# Altium project Phone_Charger.PrjPcb (part 2 of 3)

## Sheet Battery_Management_Section.SchDoc
size A4; DocumentNumber: 4; SheetNumber: 4
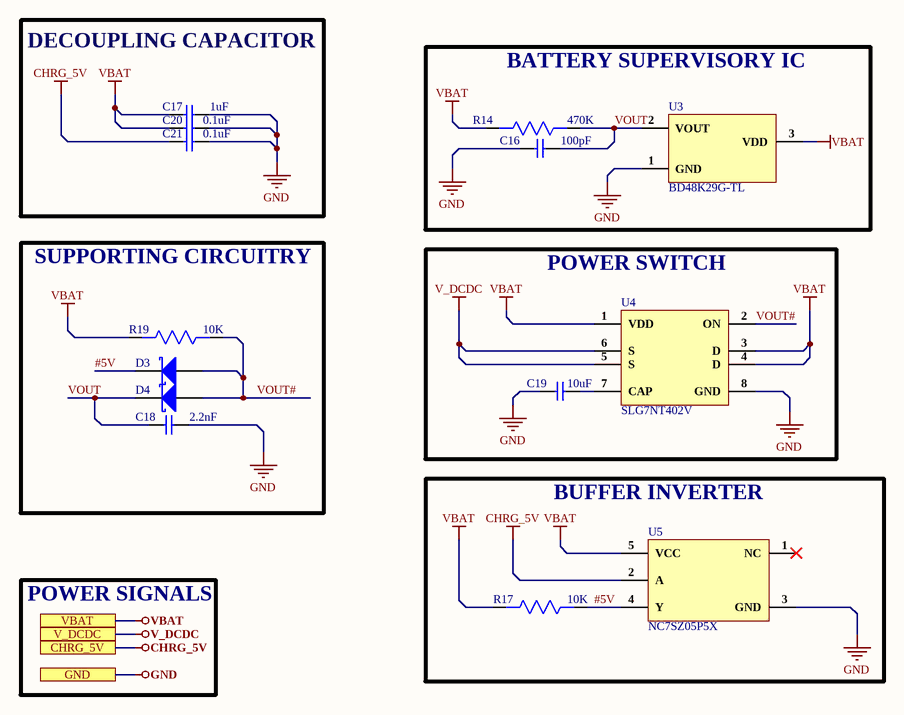
[diagram p3: Battery_Management_Section.SchDoc]

### Parts
C16  100pF  [Cap0603]
C17  1uF  [Cap0603]
C18  2.2nF  [Cap 0402]
C19  10uF  [Cap0603]
C20  0.1uF  [Cap0603]
C21  0.1uF  [Cap0603]
D3  SDM2U20SD3-7  [SDM2U20SD3-7]  (value not drawn)
D4  SDM2U20SD3-7  [SDM2U20SD3-7]  (value not drawn)
R14  470K  [Res0603]
R17  10K  [Res0603]
R19  10K  [Res0603]
U3  BD48K29G-TL  [3-SSOP]
U4  SLG7NT402V  [SLG7NT402V]
U5  NC7SZ05P5X  [NC7SZ05P5X]

### Blocks framed on the sheet
DECOUPLING CAPACITOR: C17 C20 C21
BATTERY SUPERVISORY IC: C16 R14 U3
SUPPORTING CIRCUITRY: C18 D3 D4 R19
POWER SWITCH: C19 U4
BUFFER INVERTER: R17 U5

### Ports
CHRG_5V, GND, V_DCDC, VBAT

### Nets
CHRG_5V: C21.1 U5.2(A) ; port CHRG_5V
GND: C16.2 C17.1 C18.2 C19.1 C20.2 C21.2 U3.1(GND) U4.8(GND) U5.3(GND) ; port GND
V_DCDC: U4.5(S) U4.6(S) ; port V_DCDC
VBAT: C17.2 C20.1 R14.1 R17.2 R19.2 U3.3(VDD) U4.1(VDD) U4.3(D) U4.4(D) U5.5(VCC) ; port VBAT
#5V: D3.2(K) R17.1 U5.4(Y)
VOUT: C16.1 C18.1 D4.2(K) R14.2 U3.2(VOUT)
VOUT#: D3.1(A) D4.1(A) R19.1 U4.2(ON)
NetC19_2: C19.2 U4.7(CAP)

Not connected (* = marked no-connect by the designer): U5 1(NC)*

### Notes on the sheet
- POWER SIGNALS

### Library data of the parts
C16 = CC0603JRNPO8BN101: CAP CER 100PF 25V C0G/NPO 0603; Manufacturer: Yageo; Tolerance: 5%; Dielectric: C0G; ComponentLink1URL: http://www.yageo.com/documents/recent/UPY-GPHC_Y5V_6.3V-to-50V_8.pdf?src-supplier=Digi-Key; ComponentLink1Description: http://www.yageo.com/documents/recent/UPY-GPHC_Y5V_6.3V-to-50V_8.pdf?src-supplier=Digi-Key; ComponentLink2URL: http://www.yageo.com/documents/recent/UPY-GPHC_Y5V_6.3V-to-50V_5.pdf?src-supplier=Avnet+Europe; ComponentLink2Description: http://www.yageo.com/documents/recent/UPY-GPHC_Y5V_6.3V-to-50V_5.pdf?src-supplier=Avnet+Europe; ComponentLink3URL: https://www.verical.com/server-webapp/html/getDatasheet?partID=403611&src-supplier=Verical; ComponentLink3Description: https://www.verical.com/server-webapp/html/getDatasheet?partID=403611&src-supplier=Verical; ComponentLink4URL: http://www.mouser.com/ds/2/447/Yageo_UPY-GP_NP0_16V-to-50V_9-358835.pdf?src-supplier=Mouser; ComponentLink4Description: http://www.mouser.com/ds/2/447/Yageo_UPY-GP_NP0_16V-to-50V_9-358835.pdf?src-supplier=Mouser; ComponentLink5URL: http://www.farnell.com/datasheets/1132289.pdf?src-supplier=Element14; ComponentLink5Description: http://www.farnell.com/datasheets/1132289.pdf?src-supplier=Element14; Supplier 1: Digi-Key; Manufacturer Part Number: CC0603JRNPO8BN101; Stock 1: 19776; Pricing 1: 1=0.1, 10=0.058, 50=0.0318, 100=0.026, 500=0.0186, 1000=0.0146 (USD); Mount: Surface Mount; Case/Package: 0603; Min Operating Temperature: -55°C; Max Operating Temperature: 125°C; Capacitance: 100pF; Voltage Rating (DC): 25V; Packaging: Tape and Reel; Voltage Rating: 25V; Resistor Type: Ceramic; Series: CC; Construction: Flat; Length: 0.063inch; Width: 0.031inch; Height: 0.8mm; Thickness: 0.035inch; Depth: 0.8mm; Radiation Hardening: No; RoHS Compliant: Yes; ComponentLink6URL: http://www.yageo.com/documents/recent/UPY-GP_NP0_16V-to-50V_8.pdf?src-supplier=Avnet; ComponentLink6Description: http://www.yageo.com/documents/recent/UPY-GP_NP0_16V-to-50V_8.pdf?src-supplier=Avnet; ComponentLink7URL: http://www.yageo.com/documents/recent/UPY-GP_NP0_16V-to-50V_8.pdf?src-supplier=Avnet+Europe; ComponentLink7Description: http://www.yageo.com/documents/recent/UPY-GP_NP0_16V-to-50V_8.pdf?src-supplier=Avnet+Europe; Supplier Part Number 1: 311-3949-1-ND
C17 = CC0603ZRY5V8BB105: CAP CER 1UF 25V Y5V 0603; Manufacturer: Yageo; Tolerance: 80%; ComponentLink1URL: http://www.yageo.com/documents/recent/UPY-GPHC_Y5V_6.3V-to-50V_8.pdf?src-supplier=Digi-Key; ComponentLink1Description: http://www.yageo.com/documents/recent/UPY-GPHC_Y5V_6.3V-to-50V_8.pdf?src-supplier=Digi-Key; ComponentLink2URL: http://www.yageo.com/documents/recent/UPY-GPHC_Y5V_6.3V-to-50V_5.pdf?src-supplier=Avnet+Europe; ComponentLink2Description: http://www.yageo.com/documents/recent/UPY-GPHC_Y5V_6.3V-to-50V_5.pdf?src-supplier=Avnet+Europe; ComponentLink3URL: https://www.verical.com/server-webapp/html/getDatasheet?partID=403611&src-supplier=Verical; ComponentLink3Description: https://www.verical.com/server-webapp/html/getDatasheet?partID=403611&src-supplier=Verical; ComponentLink4URL: http://www.mouser.com/ds/2/447/Yageo_UPY-GP_NP0_16V-to-50V_9-358835.pdf?src-supplier=Mouser; ComponentLink4Description: http://www.mouser.com/ds/2/447/Yageo_UPY-GP_NP0_16V-to-50V_9-358835.pdf?src-supplier=Mouser; ComponentLink5URL: http://www.farnell.com/datasheets/1132289.pdf?src-supplier=Element14; ComponentLink5Description: http://www.farnell.com/datasheets/1132289.pdf?src-supplier=Element14; Supplier 1: Digi-Key; Manufacturer Part Number: CC0603ZRY5V8BB105; Stock 1: 82432; Pricing 1: 1=0.13, 10=0.096, 50=0.0544, 100=0.045, 500=0.0316, 1000=0.0261 (USD); Mount: Surface Mount; Case/Package: 0603; Case Code (Imperial): 0603; Case Code (Metric): 1608; Min Operating Temperature: -30°C; Max Operating Temperature: 85°C; Voltage Rating (DC): 25V; Packaging: Tape and Reel; Capacitance: 1uF; Voltage Rating: 25V; Dielectric: Y5V; Termination: SMD/SMT; Resistor Type: Ceramic; Series: CC; Length: 0.063inch; Width: 0.031inch; Height: 0.8mm; Thickness: 0.035inch; Lead Free: Lead Free; Halogen Free: Halogen Free; RoHS Compliant: Yes; Supplier Part Number 1: 311-1829-1-ND
C18 = C0402C222J3GEC7867: CAP CER 0402 2.2NF 25V C0G 5%; Manufacturer: KEMET; ComponentLink1URL: http://www.yageo.com/documents/recent/UPY-GPHC_Y5V_6.3V-to-50V_8.pdf?src-supplier=Digi-Key; ComponentLink1Description: http://www.yageo.com/documents/recent/UPY-GPHC_Y5V_6.3V-to-50V_8.pdf?src-supplier=Digi-Key; ComponentLink2URL: http://www.yageo.com/documents/recent/UPY-GPHC_Y5V_6.3V-to-50V_5.pdf?src-supplier=Avnet+Europe; ComponentLink2Description: http://www.yageo.com/documents/recent/UPY-GPHC_Y5V_6.3V-to-50V_5.pdf?src-supplier=Avnet+Europe; ComponentLink3URL: https://www.verical.com/server-webapp/html/getDatasheet?partID=403611&src-supplier=Verical; ComponentLink3Description: https://www.verical.com/server-webapp/html/getDatasheet?partID=403611&src-supplier=Verical; ComponentLink4URL: http://www.mouser.com/ds/2/447/Yageo_UPY-GP_NP0_16V-to-50V_9-358835.pdf?src-supplier=Mouser; ComponentLink4Description: http://www.mouser.com/ds/2/447/Yageo_UPY-GP_NP0_16V-to-50V_9-358835.pdf?src-supplier=Mouser; ComponentLink5URL: http://www.farnell.com/datasheets/1132289.pdf?src-supplier=Element14; ComponentLink5Description: http://www.farnell.com/datasheets/1132289.pdf?src-supplier=Element14; ComponentLink6URL: http://www.yageo.com/documents/recent/UPY-GP_NP0_16V-to-50V_8.pdf?src-supplier=Avnet; ComponentLink6Description: http://www.yageo.com/documents/recent/UPY-GP_NP0_16V-to-50V_8.pdf?src-supplier=Avnet; ComponentLink7URL: http://www.yageo.com/documents/recent/UPY-GP_NP0_16V-to-50V_8.pdf?src-supplier=Avnet+Europe; ComponentLink7Description: http://www.yageo.com/documents/recent/UPY-GP_NP0_16V-to-50V_8.pdf?src-supplier=Avnet+Europe; Supplier 1: Digi-Key; Manufacturer Part Number: C0402C222J3GEC7867; Stock 1: 5024; Pricing 1: 1=0.17, 10=0.123, 50=0.07, 100=0.058, 500=0.0407, 1000=0.0337, 2500=0.0314, 5000=0.0287 (USD); ComponentLink8URL: https://api.kemet.com/component-edge/download/datasheet/C0402C222J3GEC7867.pdf?src-supplier=Digi-Key; ComponentLink8Description: https://api.kemet.com/component-edge/download/datasheet/C0402C222J3GEC7867.pdf?src-supplier=Digi-Key; Supplier Part Number 1: 399-C0402C222J3GEC7867CT-ND
C19 = CC0603MRX5R8BB106: CAP CER 10UF 25V X5R 0603; Manufacturer: Yageo; Tolerance: 20%; ComponentLink1URL: http://www.yageo.com/documents/recent/UPY-GPHC_Y5V_6.3V-to-50V_8.pdf?src-supplier=Digi-Key; ComponentLink1Description: http://www.yageo.com/documents/recent/UPY-GPHC_Y5V_6.3V-to-50V_8.pdf?src-supplier=Digi-Key; ComponentLink2URL: http://www.yageo.com/documents/recent/UPY-GPHC_Y5V_6.3V-to-50V_5.pdf?src-supplier=Avnet+Europe; ComponentLink2Description: http://www.yageo.com/documents/recent/UPY-GPHC_Y5V_6.3V-to-50V_5.pdf?src-supplier=Avnet+Europe; ComponentLink3URL: https://www.verical.com/server-webapp/html/getDatasheet?partID=403611&src-supplier=Verical; ComponentLink3Description: https://www.verical.com/server-webapp/html/getDatasheet?partID=403611&src-supplier=Verical; ComponentLink4URL: http://www.mouser.com/ds/2/447/Yageo_UPY-GP_NP0_16V-to-50V_9-358835.pdf?src-supplier=Mouser; ComponentLink4Description: http://www.mouser.com/ds/2/447/Yageo_UPY-GP_NP0_16V-to-50V_9-358835.pdf?src-supplier=Mouser; ComponentLink5URL: http://www.farnell.com/datasheets/1132289.pdf?src-supplier=Element14; ComponentLink5Description: http://www.farnell.com/datasheets/1132289.pdf?src-supplier=Element14; Supplier 1: Digi-Key; Manufacturer Part Number: CC0603MRX5R8BB106; Stock 1: 0; Pricing 1: 1=0.77, 10=0.568, 50=0.4542, 100=0.3893, 500=0.3082, 1000=0.2595 (USD); Mount: Surface Mount; Case/Package: 0603; Case Code (Imperial): 0603; Case Code (Metric): 1608; Min Operating Temperature: -55°C; Max Operating Temperature: 85°C; Packaging: Cut Tape; Capacitance: 10uF; Voltage Rating: 25V; RoHS Compliant: Yes; ComponentLink6URL: https://www.yageo.com/upload/media/product/productsearch/datasheet/mlcc/UPY-GPHC_X5R_4V-to-50V_26.pdf?src-supplier=Digi-Key; ComponentLink6Description: https://www.yageo.com/upload/media/product/productsearch/datasheet/mlcc/UPY-GPHC_X5R_4V-to-50V_26.pdf?src-supplier=Digi-Key; Supplier Part Number 1: 311-3494-6-ND
C20 C21 = CC0603ZRY5V9BB104: CAP CER 0.1UF 50V Y5V 0603; Manufacturer: Yageo; Capacitance: 100nF; Tolerance: 80%; Supplier 1: Digi-Key; Manufacturer Part Number: CC0603ZRY5V9BB104; Stock 1: 15000880; Pricing 1: 1=0.1, 10=0.075, 100=0.0334, 500=0.02386, 1000=0.01874 (USD); Mount: Surface Mount; Case/Package: 0603; Number of Pins: 2; Case Code (Metric): 1608; Case Code (Imperial): 0603; Min Operating Temperature: -30°C; Max Operating Temperature: 85°C; Dielectric: Y5V; Voltage Rating: 50V; Package Quantity: 1; Packaging: Tape and Reel; Voltage Rating (DC): 50V; Termination: SMD/SMT; Composition: Ceramic; Voltage: 50V; Length: 1.6mm; Height: 0.8mm; Width: 0.031inch; Thickness: 0.035inch; Depth: 0.8mm; Radiation Hardening: No; REACH SVHC: No SVHC; Lead Free: Lead Free; Halogen Free: Halogen Free; ComponentLink1URL: http://www.yageo.com/documents/recent/UPY-GPHC_Y5V_6.3V-to-50V_8.pdf?src-supplier=Digi-Key; ComponentLink1Description: http://www.yageo.com/documents/recent/UPY-GPHC_Y5V_6.3V-to-50V_8.pdf?src-supplier=Digi-Key; ComponentLink2URL: http://www.yageo.com/documents/recent/UPY-GPHC_Y5V_6.3V-to-50V_5.pdf?src-supplier=Avnet+Europe; ComponentLink2Description: http://www.yageo.com/documents/recent/UPY-GPHC_Y5V_6.3V-to-50V_5.pdf?src-supplier=Avnet+Europe; ComponentLink3URL: https://www.verical.com/server-webapp/html/getDatasheet?partID=403611&src-supplier=Verical; ComponentLink3Description: https://www.verical.com/server-webapp/html/getDatasheet?partID=403611&src-supplier=Verical; ComponentLink4URL: http://www.mouser.com/ds/2/447/Yageo_UPY-GP_NP0_16V-to-50V_9-358835.pdf?src-supplier=Mouser; ComponentLink4Description: http://www.mouser.com/ds/2/447/Yageo_UPY-GP_NP0_16V-to-50V_9-358835.pdf?src-supplier=Mouser; ComponentLink5URL: http://www.farnell.com/datasheets/1132289.pdf?src-supplier=Element14; ComponentLink5Description: http://www.farnell.com/datasheets/1132289.pdf?src-supplier=Element14; Supplier Part Number 1: 311-1343-1-ND
D3 D4 = SDM2U20SD3-7: DIODE SCHOTTKY 20V 2A SOD323; Manufacturer: Diodes; Supplier 1: Digi-Key; Manufacturer Part Number: SDM2U20SD3-7; RoHS: Yes; Category: Rectifier Diodes; Stock 1: 6; Pricing 1: 1=0.47000, 10=0.35200, 100=0.19930, 500=0.13200, 1000=0.10120 (USD); Mount: Surface Mount; Packaging: Cut Tape; Average Rectified Current: 2A; Max Reverse Voltage (DC): 20V; RoHS Compliant: Yes; ComponentLink1URL: http://www.mouser.com/ds/2/115/SDM2U20SD3-537776.pdf?src-supplier=Mouser; ComponentLink1Description: http://www.mouser.com/ds/2/115/SDM2U20SD3-537776.pdf?src-supplier=Mouser; ComponentLink2URL: https://www.diodes.com/assets/Datasheets/SDM2U20SD3.pdf?src-supplier=Digi-Key; ComponentLink2Description: https://www.diodes.com/assets/Datasheets/SDM2U20SD3.pdf?src-supplier=Digi-Key; ComponentLink3URL: http://diodes.com/datasheets/SDM2U20SD3.pdf?src-supplier=Avnet; ComponentLink3Description: http://diodes.com/datasheets/SDM2U20SD3.pdf?src-supplier=Avnet; Supplier Part Number 1: SDM2U20SD3-7DICT-ND
R14 = RC0603JR-07470KL: RES 470K OHM 5% 1/10W 0603; Manufacturer: Yageo; Resistance: 470kR; Temperature Coefficient: 100ppm/°C; Voltage Rating (DC): 50V; Power Rating: 100mW; Voltage Rating: 75V; ComponentLink1URL: https://datasheet.ciiva.com/2452/pyu-r-int-thick-7-2452918.pdf?src-supplier=Digi-Key; ComponentLink1Description: https://datasheet.ciiva.com/2452/pyu-r-int-thick-7-2452918.pdf?src-supplier=Digi-Key; ComponentLink2URL: https://datasheet.ciiva.com/2452/pyu-r-int-thick-7-2452919.pdf?src-supplier=Digi-Key; ComponentLink2Description: https://datasheet.ciiva.com/2452/pyu-r-int-thick-7-2452919.pdf?src-supplier=Digi-Key; ComponentLink3URL: https://datasheet.ciiva.com/7746/443971-7746489.pdf?src-supplier=Element14; ComponentLink3Description: https://datasheet.ciiva.com/7746/443971-7746489.pdf?src-supplier=Element14; ComponentLink4URL: https://datasheet.ciiva.com/7746/443971-7746490.pdf?src-supplier=Element14; ComponentLink4Description: https://datasheet.ciiva.com/7746/443971-7746490.pdf?src-supplier=Element14; ComponentLink5URL: https://datasheet.ciiva.com/46395/443971-46395146.pdf?src-supplier=Element14; ComponentLink5Description: https://datasheet.ciiva.com/46395/443971-46395146.pdf?src-supplier=Element14; ComponentLink6URL: https://datasheet.ciiva.com/15189/getdatasheetpartid-343810-15189869.pdf?src-supplier=Verical; ComponentLink6Description: https://datasheet.ciiva.com/15189/getdatasheetpartid-343810-15189869.pdf?src-supplier=Verical; Supplier 1: Digi-Key; Manufacturer Part Number: RC0603JR-07470KL; Stock 1: 1213798; Pricing 1: 1=0.1, 10=0.02, 100=0.008, 1000=0.0036, 2500=0.0031 (USD); Case/Package: 0603; Number of Pins: 2; Case Code (Metric): 1608; Case Code (Imperial): 0603; Weight: 7.1E-05oz; Size Code: 0603; Min Operating Temperature: -55°C; Max Operating Temperature: 155°C; Tolerance: 5%; Resistor Type: Thick Film; Packaging: Tape and Reel; Package Quantity: 1; Number of Terminations: 2; Termination: SMD/SMT; Max Power Dissipation: 100mW; Features: Moisture Resistant; Series: RC; Resistance Tolerance: 5%; Construction: Rectangular; Length: 1.6mm; Width: 0.8mm; Height: 0.022inch; Depth: 0.8mm; REACH SVHC: No SVHC; Lead Free: Lead Free; Military Standard: Not; RoHS Compliant: Yes; ComponentLink7URL: http://www.yageo.com/documents/recent/PYu-RC_Group_51_RoHS_L_10.pdf?src-supplier=Digi-Key; ComponentLink7Description: http://www.yageo.com/documents/recent/PYu-RC_Group_51_RoHS_L_10.pdf?src-supplier=Digi-Key; ComponentLink8URL: http://www.yageo.com/documents/recent/PYu-RC_Group_51_RoHS_L_9.pdf?src-supplier=Digi-Key; ComponentLink8Description: http://www.yageo.com/documents/recent/PYu-RC_Group_51_RoHS_L_9.pdf?src-supplier=Digi-Key; ComponentLink9URL: http://www.farnell.com/datasheets/1868787.pdf?src-supplier=Element14; ComponentLink9Description: http://www.farnell.com/datasheets/1868787.pdf?src-supplier=Element14; Supplier Part Number 1: 311-470KGRCT-ND
R17 R19 = AC0603JR-0710KL: RES SMD 10K OHM 5% 1/10W 0603; Manufacturer: Yageo; Voltage Rating: 50V; Resistance: 10kR; Power Rating: 100mW; Temperature Coefficient: 100ppm/°C; Supplier 1: Future Electronics; Manufacturer Part Number: AC0603JR-0710KL; RoHS: Yes; Category: Chip SMD Resistors; Stock 1: 1533000; Pricing 1: 5000=0.00540 (USD); Case/Package: 0603; Case Code (Imperial): 0603; Case Code (Metric): 1608; Size Code: 0603; Min Operating Temperature: -55°C; Max Operating Temperature: 155°C; Packaging: Tape and Reel; Tolerance: 5%; Package Quantity: 1; Resistor Type: Thick Film; Termination: SMD/SMT; Number of Terminations: 2; Max Power Dissipation: 100mW; Features: Moisture Resistant,Automotive AEC-Q200,Anti-Sulfur; Series: AC; Construction: Rectangular; Length: 0.063inch; Width: 0.031inch; Height: 0.022inch; Depth: 0.8mm; Military Standard: Not; Lead Free: Lead Free; RoHS Compliant: Yes; ComponentLink1URL: https://datasheet.ciiva.com/5562/pyu-ac-51-rohs-l-2-5562553.pdf?src-supplier=Mouser; ComponentLink1Description: https://datasheet.ciiva.com/5562/pyu-ac-51-rohs-l-2-5562553.pdf?src-supplier=Mouser; Supplier Part Number 1: 1029044
U3 = BD48K29G-TL: IC DETECTOR VOLT 2.9V OD SSOP3; Manufacturer: Rohm; Max Supply Voltage: 6V; Min Supply Voltage: 2.3V; Number of Voltages Monitored: 1; Reset: Active Low; Accuracy: 1%; Operating Supply Current: 900nA; Max Reset Threshold Voltage: 2.929V; Min Reset Threshold Voltage: 2.871V; Supplier 1: Mouser; Manufacturer Part Number: BD48K29G-TL; RoHS: Yes; Category: Voltage Supervisors; Stock 1: 2854; Pricing 1: 1=0.48000, 10=0.39100, 50=0.39100, 100=0.24100, 500=0.20000, 1000=0.15000, 3000=0.13600, 10000=0.13600 (USD); Mount: Surface Mount; Case/Package: SSOP; Number of Pins: 3; Min Operating Temperature: -40°C; Max Operating Temperature: 105°C; Packaging: Tape and Reel; Package Quantity: 1; Threshold Voltage: 2.9V; Number of Monitored Inputs: 1; Type: Simple Reset/Power-On Reset,Voltage Detector; Series: BD48xxx; Radiation Hardening: No; Lead Free: Lead Free; RoHS Compliant: Yes; ComponentLink1URL: https://datasheet.ciiva.com/15105/getdatasheetpartid-705726-15105774.pdf?src-supplier=Verical; ComponentLink1Description: https://datasheet.ciiva.com/15105/getdatasheetpartid-705726-15105774.pdf?src-supplier=Verical; ComponentLink2URL: https://datasheet.ciiva.com/6598/bd48xxg-e-6598662.pdf?src-supplier=Digi-Key; ComponentLink2Description: https://datasheet.ciiva.com/6598/bd48xxg-e-6598662.pdf?src-supplier=Digi-Key; Supplier Part Number 1: 755-BD48K29G-TL
U4 = SLG7NT402V: IC PWR SWITCH N-CHAN 1:1 8TDFN; Manufacturer: Dialog Semiconductor; Number of Outputs: 1; Output Configuration: High Side; Max Output Current: 4A; ComponentLink1URL: https://datasheet.ciiva.com/3231/lmr62014-3231410.pdf?src-supplier=Avnet; ComponentLink1Description: https://datasheet.ciiva.com/3231/lmr62014-3231410.pdf?src-supplier=Avnet; ComponentLink2URL: https://datasheet.ciiva.com/23854/1777788-23854326.pdf?src-supplier=Newark; ComponentLink2Description: https://datasheet.ciiva.com/23854/1777788-23854326.pdf?src-supplier=Newark; ComponentLink3URL: https://datasheet.ciiva.com/4879/snvs735a-74121-4879731.pdf?src-supplier=Mouser; ComponentLink3Description: https://datasheet.ciiva.com/4879/snvs735a-74121-4879731.pdf?src-supplier=Mouser; ComponentLink4URL: https://datasheet.ciiva.com/22669/1716576-22669414.pdf?src-supplier=Element14; ComponentLink4Description: https://datasheet.ciiva.com/22669/1716576-22669414.pdf?src-supplier=Element14; ComponentLink5URL: https://datasheet.ciiva.com/6603/lmr62014-6603804.pdf?src-supplier=Digi-Key; ComponentLink5Description: https://datasheet.ciiva.com/6603/lmr62014-6603804.pdf?src-supplier=Digi-Key; ComponentLink6URL: https://datasheet.ciiva.com/6603/lmr62014-6603807.pdf?src-supplier=Digi-Key; ComponentLink6Description: https://datasheet.ciiva.com/6603/lmr62014-6603807.pdf?src-supplier=Digi-Key; ComponentLink7URL: https://www.verical.com/server-webapp/html/getDatasheet?partID=705722&src-supplier=Verical; ComponentLink7Description: https://www.verical.com/server-webapp/html/getDatasheet?partID=705722&src-supplier=Verical; ComponentLink8URL: http://rohmfs.rohm.com/en/techdata_basic/ic/package/ssop3_1-e.pdf?src-supplier=Digi-Key; ComponentLink8Description: http://rohmfs.rohm.com/en/techdata_basic/ic/package/ssop3_1-e.pdf?src-supplier=Digi-Key; ComponentLink9URL: http://rohmfs.rohm.com/en/products/databook/datasheet/ic/power/voltage_detector/bd48xxg-e.pdf?src-supplier=Digi-Key; ComponentLink9Description: http://rohmfs.rohm.com/en/products/databook/datasheet/ic/power/voltage_detector/bd48xxg-e.pdf?src-supplier=Digi-Key; Supplier 1: Digi-Key; Manufacturer Part Number: SLG7NT402V; Stock 1: 74575; Pricing 1: 1=0.67, 10=0.591, 25=0.5548, 100=0.4529, 250=0.4206, 500=0.358, 1000=0.2864 (USD); Number of Pins: 8; Min Operating Temperature: -20°C; Max Operating Temperature: 70°C; Packaging: Cut Tape; Supplier Part Number 1: 1827-1124-1-ND
U5 = NC7SZ05P5X: IC INVERTER OD 1CH 1-INP SC70-5; Manufacturer: ON Semiconductor / Fairchild; Number of Terminals/Pins: 5; Number of Circuits: 1; Max Supply Voltage: 5.5V; Min Supply Voltage: 1.65V; Propagation Delay: 13.4ns; Logic Function: Buffer,Inverter; Output Current: 32mA; Quiescent Current: 2uA; Turn-On Delay Time: 4.3ns; Polarity: Inverting; Schmitt Trigger Input: No; Input Type: SINGLE-ENDED; ComponentLink1URL: https://datasheet.ciiva.com/3231/lmr62014-3231410.pdf?src-supplier=Avnet; ComponentLink1Description: https://datasheet.ciiva.com/3231/lmr62014-3231410.pdf?src-supplier=Avnet; ComponentLink2URL: https://datasheet.ciiva.com/23854/1777788-23854326.pdf?src-supplier=Newark; ComponentLink2Description: https://datasheet.ciiva.com/23854/1777788-23854326.pdf?src-supplier=Newark; ComponentLink3URL: https://datasheet.ciiva.com/4879/snvs735a-74121-4879731.pdf?src-supplier=Mouser; ComponentLink3Description: https://datasheet.ciiva.com/4879/snvs735a-74121-4879731.pdf?src-supplier=Mouser; ComponentLink4URL: https://datasheet.ciiva.com/22669/1716576-22669414.pdf?src-supplier=Element14; ComponentLink4Description: https://datasheet.ciiva.com/22669/1716576-22669414.pdf?src-supplier=Element14; ComponentLink5URL: https://datasheet.ciiva.com/6603/lmr62014-6603804.pdf?src-supplier=Digi-Key; ComponentLink5Description: https://datasheet.ciiva.com/6603/lmr62014-6603804.pdf?src-supplier=Digi-Key; ComponentLink6URL: https://datasheet.ciiva.com/6603/lmr62014-6603807.pdf?src-supplier=Digi-Key; ComponentLink6Description: https://datasheet.ciiva.com/6603/lmr62014-6603807.pdf?src-supplier=Digi-Key; Supplier 1: Digi-Key; Manufacturer Part Number: NC7SZ05P5X; RoHS: Yes; Category: Amplifiers - Op Amps, Buffer, Instrumentation; Stock 1: 165573; Pricing 1: 1=0.41000, 10=0.30800, 25=0.26920, 100=0.17430, 250=0.14428, 500=0.11544, 1000=0.08850 (USD); Mount: Surface Mount; Case/Package: SC; Number of Pins: 5; Weight: 23g; Min Operating Temperature: -40°C; Max Operating Temperature: 85°C; Packaging: Tape and Reel; Package Quantity: 1; Low Level Output Current: 32mA; Number of Gates: 1; Number of Channels: 1; Number of Inputs: 1; Number of Outputs: 1; Max Output Current: 32mA; Number of Elements: 1; Termination: SMD/SMT; Series: 7SZ; Technology: CMOS; Number of Functions: 1; Supply Voltage-Nom: 5.5V; Length: 2mm; Width: 1.25mm; Height: 1mm; Radiation Hardening: No; REACH SVHC: No SVHC; Lead Free: Lead Free; RoHS Compliant: Yes; ComponentLink7URL: https://datasheet.ciiva.com/5701/678459-5701517.pdf?src-supplier=Farnell; ComponentLink7Description: https://datasheet.ciiva.com/5701/678459-5701517.pdf?src-supplier=Farnell; ComponentLink8URL: https://datasheet.ciiva.com/26097/nc7sz05-26097353.pdf?src-supplier=Avnet+Europe; ComponentLink8Description: https://datasheet.ciiva.com/26097/nc7sz05-26097353.pdf?src-supplier=Avnet+Europe; ComponentLink9URL: https://datasheet.ciiva.com/46415/678459-46415099.pdf?src-supplier=Element14; ComponentLink9Description: https://datasheet.ciiva.com/46415/678459-46415099.pdf?src-supplier=Element14; ComponentLink10URL: https://datasheet.ciiva.com/16783/nc7sz05-16783085.pdf?src-supplier=Future+Electronics; ComponentLink10Description: https://datasheet.ciiva.com/16783/nc7sz05-16783085.pdf?src-supplier=Future+Electronics; ComponentLink11URL: https://datasheet.ciiva.com/1861/nc7sz05-1861934.pdf?src-supplier=Digi-Key; ComponentLink11Description: https://datasheet.ciiva.com/1861/nc7sz05-1861934.pdf?src-supplier=Digi-Key; ComponentLink12URL: https://datasheet.ciiva.com/7970/678459-7970639.pdf?src-supplier=Element14; ComponentLink12Description: https://datasheet.ciiva.com/7970/678459-7970639.pdf?src-supplier=Element14; ComponentLink13URL: https://datasheet.ciiva.com/1861/nc7sz05-1861932.pdf?src-supplier=Digi-Key; ComponentLink13Description: https://datasheet.ciiva.com/1861/nc7sz05-1861932.pdf?src-supplier=Digi-Key; ComponentLink14URL: https://datasheet.ciiva.com/5701/nc7sz05-5701516.pdf?src-supplier=Farnell; ComponentLink14Description: https://datasheet.ciiva.com/5701/nc7sz05-5701516.pdf?src-supplier=Farnell; ComponentLink15URL: https://datasheet.ciiva.com/1861/nc7sz05-1861933.pdf?src-supplier=Digi-Key; ComponentLink15Description: https://datasheet.ciiva.com/1861/nc7sz05-1861933.pdf?src-supplier=Digi-Key; Supplier Part Number 1: NC7SZ05P5XCT-ND

## Sheet Connector_Section.SchDoc
size A4; DocumentNumber: 9; SheetNumber: 9; SheetTotal: 8
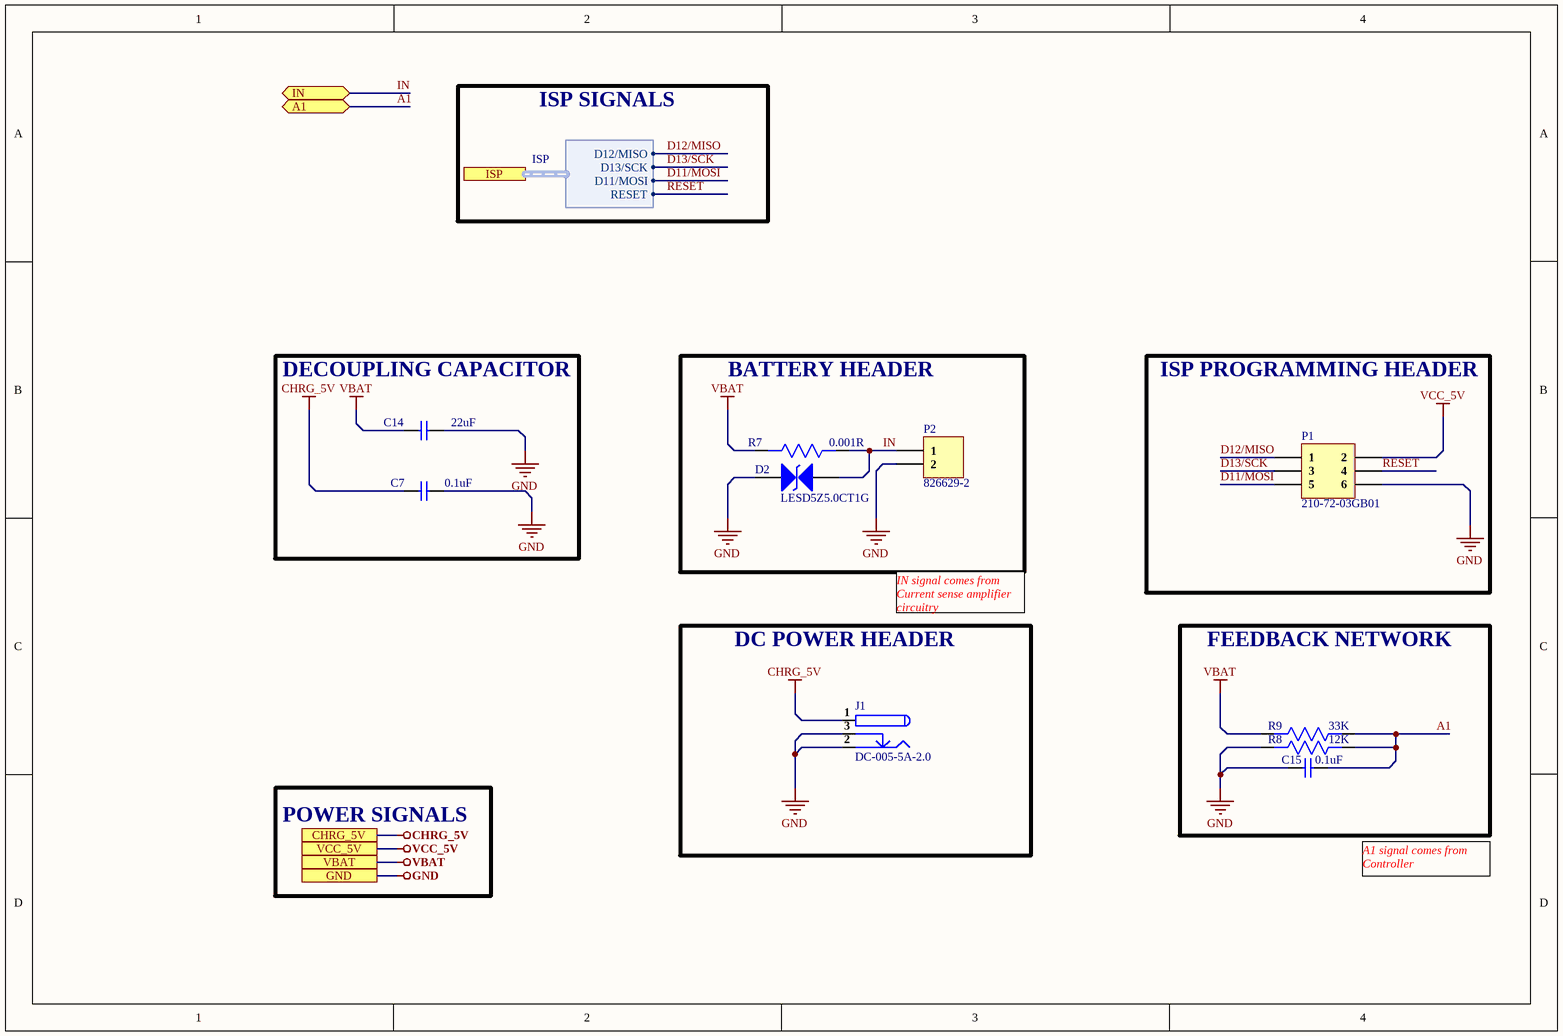
[diagram p4: Connector_Section.SchDoc]

### Parts
C7  0.1uF  [Cap0603]
C14  22uF  [Cap0805]
C15  0.1uF  [Cap0603]
D2  LESD5Z5.0CT1G  [LESD5Z5.0CT1G]
J1  DC-005-5A-2.0  [DC-005-5A-2.0]
P1  210-72-03GB01  [HDR2X3]
P2  826629-2  [HDR1X2]
R7  0.001R  [RES 2512]
R8  12K  [Res0603]
R9  33K  [Res0603]

### Blocks framed on the sheet
DECOUPLING CAPACITOR: C7 C14
BATTERY HEADER: D2 P2 R7
ISP PROGRAMMING HEADER: P1
DC POWER HEADER: J1
FEEDBACK NETWORK: C15 R8 R9

### Ports
A1 (bidir), CHRG_5V, GND, IN (bidir), ISP (harness ISP), VBAT, VCC_5V

### Harnesses
ISP: D12/MISO, D13/SCK, D11/MOSI, RESET

### Nets
CHRG_5V: C7.1 J1.1 ; port CHRG_5V
GND: C7.2 C14.2 C15.2 D2.1(A) J1.2 J1.3 P1.6 P2.2 R8.2 ; port GND
VBAT: C14.1 R7.2 R9.2 ; port VBAT
VCC_5V: P1.2 ; port VCC_5V
A1: C15.1 R8.1 R9.1 ; port A1
D11/MOSI: P1.5 ; port ISP.D11/MOSI
D12/MISO: P1.1 ; port ISP.D12/MISO
D13/SCK: P1.3 ; port ISP.D13/SCK
IN: D2.2(A) P2.1 R7.1 ; port IN
RESET: P1.4 ; port ISP.RESET

### Notes on the sheet
- ISP SIGNALS
- IN signal comes from Current sense amplifier circuitry
- POWER SIGNALS
- A1 signal comes from Controller

### Library data of the parts
C7 C15 = CC0603ZRY5V9BB104: as C20 on sheet Battery_Management_Section; Supplier 1: Digi-Key; Manufacturer Part Number: CC0603ZRY5V9BB104; Stock 1: 15000880; Pricing 1: 1=0.1, 10=0.075, 100=0.0334, 500=0.02386, 1000=0.01874 (USD); Mount: Surface Mount; Case/Package: 0603; Number of Pins: 2; Case Code (Metric): 1608; Case Code (Imperial): 0603; Min Operating Temperature: -30°C; Max Operating Temperature: 85°C; Dielectric: Y5V; Voltage Rating: 50V; Package Quantity: 1; Packaging: Tape and Reel; Voltage Rating (DC): 50V; Termination: SMD/SMT; Composition: Ceramic; Voltage: 50V; Length: 1.6mm; Height: 0.8mm; Width: 0.031inch; Thickness: 0.035inch; Depth: 0.8mm; Radiation Hardening: No; REACH SVHC: No SVHC; Lead Free: Lead Free; Halogen Free: Halogen Free; ComponentLink1URL: http://www.yageo.com/documents/recent/UPY-GPHC_Y5V_6.3V-to-50V_8.pdf?src-supplier=Digi-Key; ComponentLink1Description: http://www.yageo.com/documents/recent/UPY-GPHC_Y5V_6.3V-to-50V_8.pdf?src-supplier=Digi-Key; ComponentLink2URL: http://www.yageo.com/documents/recent/UPY-GPHC_Y5V_6.3V-to-50V_5.pdf?src-supplier=Avnet+Europe; ComponentLink2Description: http://www.yageo.com/documents/recent/UPY-GPHC_Y5V_6.3V-to-50V_5.pdf?src-supplier=Avnet+Europe; ComponentLink3URL: https://www.verical.com/server-webapp/html/getDatasheet?partID=403611&src-supplier=Verical; ComponentLink3Description: https://www.verical.com/server-webapp/html/getDatasheet?partID=403611&src-supplier=Verical; ComponentLink4URL: http://www.mouser.com/ds/2/447/Yageo_UPY-GP_NP0_16V-to-50V_9-358835.pdf?src-supplier=Mouser; ComponentLink4Description: http://www.mouser.com/ds/2/447/Yageo_UPY-GP_NP0_16V-to-50V_9-358835.pdf?src-supplier=Mouser; ComponentLink5URL: http://www.farnell.com/datasheets/1132289.pdf?src-supplier=Element14; ComponentLink5Description: http://www.farnell.com/datasheets/1132289.pdf?src-supplier=Element14; Supplier Part Number 1: 311-1343-1-ND
C14 = C2012X5R1V226MT000E: CAP CER 22UF 35V X5R 0805
D2 = LESD5Z5.0CT1G: SOD-523 ESD Protection Devices ROHS; Manufacturer: UMW; Value: Custom; Manufacturer Part No: LESD5Z5.0CT1G; Package: SOD-523; ComponentLink1Description: LCSC; ComponentLink1URL: https://lcsc.com/product-detail/span-style-background-color-ff0-ESD-span-Protection-Devices_UMW-Youtai-Semiconductor-Co-Ltd-LESD5Z5-0CT1G_C2833276.html
J1 = DC-005-5A-2.0: DC Power Receptacle 2mm 6.2mm 5A 24V Plugin AC/DC Power Connectors ROHS; Manufacturer: XKB Connectivity; Manufacutrer Part No:: DC-005-5A-2.0; Package: Custom; ComponentLink1Description: New link; ComponentLink1URL: https://datasheet.lcsc.com/lcsc/2110151630_XKB-Connectivity-DC-005-5A-2-0_C381116.pdf
P1 = 210-72-03GB01: Straight Square Pins 2.5mm 6.1mm -40℃~+105℃ 2 3mm 6 2.54mm Black Brass 2x3P 2.54mm Plugin,P=2.54mm Pin Headers ROHS; Manufacturer: PINREX; Manufacturer Part no:: 210-72-03GB01; Package: Custom; ComponentLink1Description: New link; ComponentLink1URL: https://lcsc.com/product-detail/Pin-Headers_PINREX-210-72-03GB01_C402781.html
P2 = 826629-2: CONN HEADER VERT 2POS 2.54MM; Manufacturer: TE Connectivity; Manufacturer Part Number: 8266292; Number of Contacts: 2; Connector Type: Plug,Header,Pin; Current Rating: 3A; Board Standoff: No (Without); High Speed Serial Data Connector: No; PCB Mount Retention: Without; Gender: Male; PCB Mounting Orientation: Vertical; Contact Post Length: 0.1259inch; Plating Thickness: 0.8um; Supplier 1: RSComponents; RoHS: Yes; Category: Board to Board Connectors; Mount: Straddle Mount; Contact Plating: Gold,Tin; Contact Material: Bronze; Color: Green; Housing Color: Green; Housing Material: PBT; Contact Shape: Square; Min Operating Temperature: -65°C; Max Operating Temperature: 105°C; Number of Rows: 1; Termination: Through Hole; Number of Positions: 2; Packaging: Carton; Package Quantity: 3000; Series: AMPMODU MOD II; Contact Type: Male Pin; Contact Gender: Male; Orientation: Straight; Contact Protection: No (Without); Gasket: No (Without); High Temperature Housing: No; Keyed: No; Mating Alignment: No (Without); Mating Connector Lock: No (Without); Selectively Loaded: No (Without); Stabilizers: No (Without); Strain Relief: No (Without); Length: 5.08mm; Pitch: 2.54mm; Contact Mating Length: 6.7mm; Row Spacing: 2.54mm; Depth: 2.5mm; Radiation Hardening: No; Flammability Rating: UL94 V-0; REACH SVHC: No SVHC; ELV: Compliant; Lead Free: Lead Free; ComponentLink1URL: https://datasheet.ciiva.com/11746/0900766b80d7c358-11746248.pdf?src-supplier=RSComponents; ComponentLink1Description: https://datasheet.ciiva.com/11746/0900766b80d7c358-11746248.pdf?src-supplier=RSComponents; ComponentLink2URL: https://datasheet.ciiva.com/30224/8266292-30224019.pdf?src-supplier=Onlinecomponents.com; ComponentLink2Description: https://datasheet.ciiva.com/30224/8266292-30224019.pdf?src-supplier=Onlinecomponents.com; ComponentLink3URL: https://datasheet.ciiva.com/29369/001094754-da-01-en-stiftleiste-1-reihig-0-0826629-2-29369600.pdf?src-supplier=Conrad; ComponentLink3Description: https://datasheet.ciiva.com/29369/001094754-da-01-en-stiftleiste-1-reihig-0-0826629-2-29369600.pdf?src-supplier=Conrad; ComponentLink4URL: https://datasheet.ciiva.com/6857/eng-cd-826629-aa-basefilename-6857135.pdf?src-supplier=Digi-Key; ComponentLink4Description: https://datasheet.ciiva.com/6857/eng-cd-826629-aa-basefilename-6857135.pdf?src-supplier=Digi-Key; ComponentLink5URL: https://datasheet.ciiva.com/14120/eh826629-draw-14120837.pdf?src-supplier=Distrelec; ComponentLink5Description: https://datasheet.ciiva.com/14120/eh826629-draw-14120837.pdf?src-supplier=Distrelec; Supplier Part Number 1: 1361864
R7 = PA2512JKF7W0R001E: RES 0.001 OHM 5% 2W 2512; Manufacturer: YEGEO; Manufacturer Part No:: PA2512JKF7W0R001E; Value: 0.001R; Package: 2512; ComponentLink1Description: New link; ComponentLink1URL: https://www.digikey.ca/en/products/detail/yageo/PA2512JKF7W0R001E/5913675?s=N4IgTCBcDaIAoEEwFYCMYBSBpAYgdgHUAGAJSKNQFEQBdAXyA
R8 = ERJ3EKF1202V: RES SMD 12K OHM 1% 1/10W 0603; Manufacturer: Panasonic; Resistance: 12kR; Temperature Coefficient: 100ppm/°C; Power Rating: 100mW; Voltage Rating: 75V; Supplier 1: RSComponents; Manufacturer Part Number: ERJ3EKF1202V; RoHS: Yes; Category: Chip SMD Resistors; Stock 1: 197000; Pricing 1: 1000=0.00500 (GBP); Mount: Surface Mount; Case/Package: 0603; Number of Pins: 2; Contact Plating: Tin; Case Code (Metric): 1608; Case Code (Imperial): 0603; Weight: 7.1E-05oz; Min Operating Temperature: -55°C; Max Operating Temperature: 155°C; Tolerance: 1%; Resistor Type: Thick Film; Packaging: Tape and Reel; Package Quantity: 5000; Number of Terminations: 2; Termination: SMD/SMT; Max Power Dissipation: 100mW; Voltage Rating (DC): 75V; Features: Automotive AEC-Q200; Series: ERJ; Resistance Tolerance: 1%; Construction: Rectangular; Length: 1.6mm; Width: 0.8mm; Height: 0.45mm; Depth: 0.8mm; Radiation Hardening: No; REACH SVHC: No SVHC; Military Standard: Not; Lead Free: Lead Free; RoHS Compliant: Yes; ComponentLink1URL: https://datasheet.ciiva.com/6138/aoa0000ce2-6138712.pdf?src-supplier=Farnell; ComponentLink1Description: https://datasheet.ciiva.com/6138/aoa0000ce2-6138712.pdf?src-supplier=Farnell; ComponentLink2URL: https://datasheet.ciiva.com/7944/aoa0000ce2-7944617.pdf?src-supplier=Element14; ComponentLink2Description: https://datasheet.ciiva.com/7944/aoa0000ce2-7944617.pdf?src-supplier=Element14; ComponentLink3URL: https://datasheet.ciiva.com/22673/1678782-22673693.pdf?src-supplier=Element14; ComponentLink3Description: https://datasheet.ciiva.com/22673/1678782-22673693.pdf?src-supplier=Element14; ComponentLink4URL: https://datasheet.ciiva.com/22687/1678782-22687413.pdf?src-supplier=Element14; ComponentLink4Description: https://datasheet.ciiva.com/22687/1678782-22687413.pdf?src-supplier=Element14; ComponentLink5URL: https://datasheet.ciiva.com/46420/1678782-46420333.pdf?src-supplier=Element14; ComponentLink5Description: https://datasheet.ciiva.com/46420/1678782-46420333.pdf?src-supplier=Element14; ComponentLink6URL: https://datasheet.ciiva.com/24165/aoa0000ce2-24165037.pdf?src-supplier=Mouser; ComponentLink6Description: https://datasheet.ciiva.com/24165/aoa0000ce2-24165037.pdf?src-supplier=Mouser; ComponentLink7URL: https://datasheet.ciiva.com/16783/70260748-16783400.pdf?src-supplier=Allied+Electronics; ComponentLink7Description: https://datasheet.ciiva.com/16783/70260748-16783400.pdf?src-supplier=Allied+Electronics; ComponentLink8URL: https://datasheet.ciiva.com/30121/aoa0000ce2-30121109.pdf?src-supplier=Onlinecomponents.com; ComponentLink8Description: https://datasheet.ciiva.com/30121/aoa0000ce2-30121109.pdf?src-supplier=Onlinecomponents.com; ComponentLink9URL: https://datasheet.ciiva.com/17211/aoa0000ce2-17211797.pdf?src-supplier=Avnet+Europe; ComponentLink9Description: https://datasheet.ciiva.com/17211/aoa0000ce2-17211797.pdf?src-supplier=Avnet+Europe; ComponentLink10URL: https://datasheet.ciiva.com/16511/aoa0000ce2-16511882.pdf?src-supplier=Avnet+Asia; ComponentLink10Description: https://datasheet.ciiva.com/16511/aoa0000ce2-16511882.pdf?src-supplier=Avnet+Asia; Supplier Part Number 1: 1763579
R9 = AC0603FR-0733KL: Res Thick Film 0603 33K Ohm 1% 1/10W ±100ppm/°C Molded SMD Paper T/R; Manufacturer: Yageo; Resistance: 33kR; Power Rating: 100mW; Voltage Rating: 50V; Supplier 1: Digi-Key; Manufacturer Part Number: AC0603FR-0733KL; RoHS: Yes; Category: Chip SMD Resistors; Stock 1: 9255; Pricing 1: 1=0.10000, 10=0.02900, 100=0.01170, 1000=0.00527, 2500=0.00458 (USD); Case/Package: 0603; Case Code (Imperial): 0603; Case Code (Metric): 1608; Min Operating Temperature: -55°C; Max Operating Temperature: 155°C; Tolerance: 1%; Packaging: Tape and Reel; Resistor Type: Thick Film; Number of Terminations: 2; Termination: SMD/SMT; Max Power Dissipation: 100mW; Temperature Coefficient: 100ppm/°C; Features: Moisture Resistant,Automotive AEC-Q200; Series: AC; Construction: Rectangular; Length: 1.6mm; Width: 0.031inch; Height: 0.022inch; Depth: 0.8mm; Military Standard: Not; Lead Free: Lead Free; RoHS Compliant: Yes; ComponentLink1URL: http://components.arrow.com/part/dataview/0323_03349868?src-supplier=Arrow+Europe; ComponentLink1Description: http://components.arrow.com/part/dataview/0323_03349868?src-supplier=Arrow+Europe; ComponentLink2URL: http://www.yageo.com/NewPortal/yageodocoutput?fileName=/pdf/R-Chip/PYu-AC_51_RoHS_L_6.pdf&src-supplier=Arrow+Electronics; ComponentLink2Description: http://www.yageo.com/NewPortal/yageodocoutput?fileName=/pdf/R-Chip/PYu-AC_51_RoHS_L_6.pdf&src-supplier=Arrow+Electronics; ComponentLink3URL: http://www.yageo.com/NewPortal/yageodocoutput?fileName=/pdf/R-Chip/PYu-AC_51_RoHS_L_6.pdf&src-supplier=Digi-Key; ComponentLink3Description: http://www.yageo.com/NewPortal/yageodocoutput?fileName=/pdf/R-Chip/PYu-AC_51_RoHS_L_6.pdf&src-supplier=Digi-Key; ComponentLink4URL: http://www.yageo.com/documents/recent/PYu-AC_51_RoHS_L_2.pdf?src-supplier=Future+Electronics; ComponentLink4Description: http://www.yageo.com/documents/recent/PYu-AC_51_RoHS_L_2.pdf?src-supplier=Future+Electronics; ComponentLink5URL: http://www.yageo.com/NewPortal/yageodocoutput?fileName=/pdf/R-Chip/PYu-AC_51_RoHS_L_6.pdf&src-supplier=Mouser; ComponentLink5Description: http://www.yageo.com/NewPortal/yageodocoutput?fileName=/pdf/R-Chip/PYu-AC_51_RoHS_L_6.pdf&src-supplier=Mouser; ComponentLink6URL: http://www.yageo.com/NewPortal/yageodocoutput?fileName=/pdf/R-Chip/PYu-AC_51_RoHS_L_6.pdf&src-supplier=Rutronik; ComponentLink6Description: http://www.yageo.com/NewPortal/yageodocoutput?fileName=/pdf/R-Chip/PYu-AC_51_RoHS_L_6.pdf&src-supplier=Rutronik; ComponentLink7URL: http://www.yageo.com/NewPortal/yageodocoutput?fileName=/pdf/R-Chip/PYu-AC_51_RoHS_L_6.pdf&src-supplier=Schukat; ComponentLink7Description: http://www.yageo.com/NewPortal/yageodocoutput?fileName=/pdf/R-Chip/PYu-AC_51_RoHS_L_6.pdf&src-supplier=Schukat; ComponentLink8URL: http://www.yageo.com/NewPortal/yageodocoutput?fileName=/pdf/R-Chip/PYu-AC_51_RoHS_L_6.pdf&src-supplier=TTI; ComponentLink8Description: http://www.yageo.com/NewPortal/yageodocoutput?fileName=/pdf/R-Chip/PYu-AC_51_RoHS_L_6.pdf&src-supplier=TTI; Supplier Part Number 1: YAG3598CT-ND

## Sheet Power_Section.SchDoc
size A4; DocumentNumber: 2; SheetNumber: 2; SheetTotal: 8
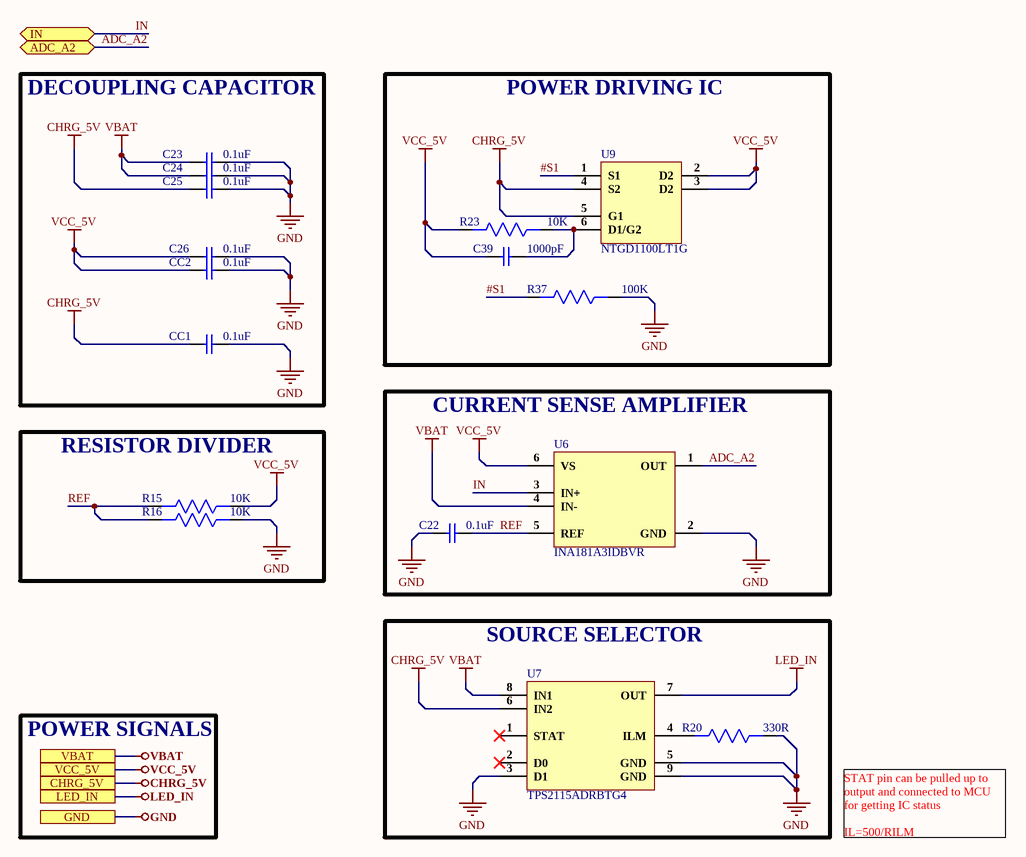
[diagram p5: Power_Section.SchDoc]

### Parts
C22  0.1uF  [Cap0603]
C23  0.1uF  [Cap0603]
C24  0.1uF  [Cap0603]
C25  0.1uF  [Cap0603]
C26  0.1uF  [Cap0603]
C39  1000pF  [Cap0603]
CC1  0.1uF  [Cap0603]
CC2  0.1uF  [Cap0603]
R15  10K  [Res0603]
R16  10K  [Res0603]
R20  330R  [Res0603]
R23  10K  [Res0603]
R37  100K  [Res0603]
U6  INA181A3IDBVR  [INA181A3IDBVR]
U7  TPS2115ADRBTG4  [TPS2115ADRBTG4]
U9  NTGD1100LT1G  [NTGD1100LT1G]

### Blocks framed on the sheet
DECOUPLING CAPACITOR: C23-C26 CC1 CC2
POWER DRIVING IC: C39 R23 R37 U9
CURRENT SENSE AMPLIFIER: C22 U6
RESISTOR DIVIDER: R15 R16
SOURCE SELECTOR: R20 U7

### Ports
ADC_A2 (bidir), CHRG_5V, GND, IN (bidir), LED_IN, VBAT, VCC_5V

### Nets
CHRG_5V: C25.1 CC1.1 U7.6(IN2) U9.4(S2) U9.5(G1) ; port CHRG_5V
GND: C22.2 C23.2 C24.2 C25.2 C26.1 CC1.2 CC2.2 R16.1 R20.1 R37.1 U6.2(GND) U7.3(D1) U7.5(GND) U7.9(GND) ; port GND
LED_IN: U7.7(OUT) ; port LED_IN
VBAT: C23.1 C24.1 U6.4(IN-) U7.8(IN1) ; port VBAT
VCC_5V: C26.2 C39.1 CC2.1 R15.1 R23.2 U6.6(VS) U9.2(D2) U9.3(D2) ; port VCC_5V
#S1: R37.2 U9.1(S1)
ADC_A2: U6.1(OUT) ; port ADC_A2
IN: U6.3(IN+) ; port IN
REF: C22.1 R15.2 R16.2 U6.5(REF)
NetC39_2: C39.2 R23.1 U9.6(D1/G2)
NetR20_2: R20.2 U7.4(ILM)

Not connected (* = marked no-connect by the designer): U7 1(STAT)* 2(D0)*

### Notes on the sheet
- POWER SIGNALS
- STAT pin can be pulled up to output and connected to MCU for getting IC status
  IL=500/RILM

### Library data of the parts
C22-C26 CC1 CC2 = CC0603ZRY5V9BB104: as C20 on sheet Battery_Management_Section; Supplier 1: Digi-Key; Manufacturer Part Number: CC0603ZRY5V9BB104; Stock 1: 15000880; Pricing 1: 1=0.1, 10=0.075, 100=0.0334, 500=0.02386, 1000=0.01874 (USD); Mount: Surface Mount; Case/Package: 0603; Number of Pins: 2; Case Code (Metric): 1608; Case Code (Imperial): 0603; Min Operating Temperature: -30°C; Max Operating Temperature: 85°C; Dielectric: Y5V; Voltage Rating: 50V; Package Quantity: 1; Packaging: Tape and Reel; Voltage Rating (DC): 50V; Termination: SMD/SMT; Composition: Ceramic; Voltage: 50V; Length: 1.6mm; Height: 0.8mm; Width: 0.031inch; Thickness: 0.035inch; Depth: 0.8mm; Radiation Hardening: No; REACH SVHC: No SVHC; Lead Free: Lead Free; Halogen Free: Halogen Free; ComponentLink1URL: http://www.yageo.com/documents/recent/UPY-GPHC_Y5V_6.3V-to-50V_8.pdf?src-supplier=Digi-Key; ComponentLink1Description: http://www.yageo.com/documents/recent/UPY-GPHC_Y5V_6.3V-to-50V_8.pdf?src-supplier=Digi-Key; ComponentLink2URL: http://www.yageo.com/documents/recent/UPY-GPHC_Y5V_6.3V-to-50V_5.pdf?src-supplier=Avnet+Europe; ComponentLink2Description: http://www.yageo.com/documents/recent/UPY-GPHC_Y5V_6.3V-to-50V_5.pdf?src-supplier=Avnet+Europe; ComponentLink3URL: https://www.verical.com/server-webapp/html/getDatasheet?partID=403611&src-supplier=Verical; ComponentLink3Description: https://www.verical.com/server-webapp/html/getDatasheet?partID=403611&src-supplier=Verical; ComponentLink4URL: http://www.mouser.com/ds/2/447/Yageo_UPY-GP_NP0_16V-to-50V_9-358835.pdf?src-supplier=Mouser; ComponentLink4Description: http://www.mouser.com/ds/2/447/Yageo_UPY-GP_NP0_16V-to-50V_9-358835.pdf?src-supplier=Mouser; ComponentLink5URL: http://www.farnell.com/datasheets/1132289.pdf?src-supplier=Element14; ComponentLink5Description: http://www.farnell.com/datasheets/1132289.pdf?src-supplier=Element14; Supplier Part Number 1: 311-1343-1-ND
C39 = 0603ZC102KAT2A: CAP CER 1000PF 10V X7R 0603; Manufacturer: Kyocera AVX; Capacitance: 1nF; Tolerance: 10%; Dissipation Factor: 5%; Supplier 1: Digi-Key; Manufacturer Part Number: 0603ZC102KAT2A; RoHS: Yes; Category: Ceramic Capacitors; Stock 1: 43409; Pricing 1: 1=0.10000, 10=0.05400, 50=0.02960, 100=0.02420, 500=0.01730, 1000=0.01360 (USD); Mount: Surface Mount; Case/Package: 0603; Number of Pins: 2; Case Code (Metric): 1608; Case Code (Imperial): 0603; Min Operating Temperature: -55°C; Max Operating Temperature: 125°C; Dielectric: X7R; Packaging: Tape and Reel; Voltage Rating: 10V; Package Quantity: 4000; Voltage Rating (DC): 10V; Termination: SMD/SMT; Series: -; Construction: Flat; Length: 1.6mm; Width: 0.032inch; Depth: 0.81mm; Thickness: 0.035inch; Radiation Hardening: No; REACH SVHC: Unknown; Lead Free: Lead Free; RoHS Compliant: Yes; ComponentLink1URL: https://datasheet.ciiva.com/204/cx7r-204553.pdf?src-supplier=Digi-Key; ComponentLink1Description: https://datasheet.ciiva.com/204/cx7r-204553.pdf?src-supplier=Digi-Key; ComponentLink2URL: https://datasheet.ciiva.com/5411/cx7r-218113-5411035.pdf?src-supplier=Mouser; ComponentLink2Description: https://datasheet.ciiva.com/5411/cx7r-218113-5411035.pdf?src-supplier=Mouser; Supplier Part Number 1: 478-0603ZC102KAT2ACT-ND
R15 R16 R23 = AC0603JR-0710KL: as R17 on sheet Battery_Management_Section; Supplier 1: Future Electronics; Manufacturer Part Number: AC0603JR-0710KL; RoHS: Yes; Category: Chip SMD Resistors; Stock 1: 1533000; Pricing 1: 5000=0.00540 (USD); Case/Package: 0603; Case Code (Imperial): 0603; Case Code (Metric): 1608; Size Code: 0603; Min Operating Temperature: -55°C; Max Operating Temperature: 155°C; Packaging: Tape and Reel; Tolerance: 5%; Package Quantity: 1; Resistor Type: Thick Film; Termination: SMD/SMT; Number of Terminations: 2; Max Power Dissipation: 100mW; Features: Moisture Resistant,Automotive AEC-Q200,Anti-Sulfur; Series: AC; Construction: Rectangular; Length: 0.063inch; Width: 0.031inch; Height: 0.022inch; Depth: 0.8mm; Military Standard: Not; Lead Free: Lead Free; RoHS Compliant: Yes; ComponentLink1URL: https://datasheet.ciiva.com/5562/pyu-ac-51-rohs-l-2-5562553.pdf?src-supplier=Mouser; ComponentLink1Description: https://datasheet.ciiva.com/5562/pyu-ac-51-rohs-l-2-5562553.pdf?src-supplier=Mouser; Supplier Part Number 1: 1029044
R20 = ERJU3RD3300V: RES SMD 0.5% 100mW 33kΩ 0603; Manufacturer: PANASONIC; Temperature Coefficient: ±50ppm/℃; Tolerance: ±0.5%; Power(Watts): 100mW; Operating Temperature Range: -55℃~+155℃
R37 = RC0603FR-07100KL: RES SMD 100K OHM 1% 1/10W 0603
U6 = INA181A3IDBVR: 26V, bi-directional, 350kHz current sense amplifier 6-SOT-23 -40 to 125; Manufacturer: Texas Instruments; Number of Circuits: 1; Slew Rate: 2V/µs; Operating Supply Current: 260uA; FET Type: 2 N-Channel; Drain to Source Voltage (Vdss): 60V; Rds On Max: 2.1mR; Input Capacitance: 4.84nF; Max Power Dissipation: 12W; Supplier 1: Digi-Key; Manufacturer Part Number: INA181A3IDBVR; RoHS: Yes; Category: Amplifiers - Op Amps, Buffer, Instrumentation; Stock 1: 3258; Pricing 1: 1=0.51000, 10=0.43700, 25=0.40800, 100=0.32650, 250=0.30316, 500=0.25652, 1000=0.19822 (USD); Mount: Surface Mount; Case/Package: SOT-23-6; Number of Pins: 22; Min Operating Temperature: -40°C; Max Operating Temperature: 125°C; Packaging: Cut Tape; -3db Bandwidth: 350kHz; RoHS Compliant: Yes; ComponentLink1URL: http://www.ti.com/lit/ds/symlink/ina181.pdf?src-supplier=Digi-Key; ComponentLink1Description: http://www.ti.com/lit/ds/symlink/ina181.pdf?src-supplier=Digi-Key; Supplier Part Number 1: 296-47658-1-ND
U7 = TPS2115ADRBTG4: Autoswitching Power Mux 8-SON -40 to 85; Manufacturer: Texas Instruments; Operating Supply Voltage: 5.5V; Number of Outputs: 1; Number of Inputs: 2; Output Current: 1.25A; Min Input Voltage: 2.8V; Turn-On Delay Time: 1ms; Supplier 1: Digi-Key; Manufacturer Part Number: TPS2115ADRBTG4; RoHS: Yes; Category: Integrated Circuits (ICs); Pricing 1: 500=1.58974 (USD); Case/Package: VSON; Number of Pins: 8; Weight: 0.000847oz; Min Operating Temperature: -40°C; Max Operating Temperature: 85°C; Package Quantity: 250; Packaging: Tape and Reel; Max Output Current: 1.25A; Max Input Voltage: 5.5V; Current - Output 2: 1.25A; Series: -; Radiation Hardening: No; Lead Free: Lead Free; RoHS Compliant: Yes; ComponentLink1URL: https://datasheet.ciiva.com/15109/getdatasheetpartid-681241-15109323.pdf?src-supplier=Verical; ComponentLink1Description: https://datasheet.ciiva.com/15109/getdatasheetpartid-681241-15109323.pdf?src-supplier=Verical; ComponentLink2URL: https://datasheet.ciiva.com/3232/tps2115a-3232539.pdf?src-supplier=Avnet; ComponentLink2Description: https://datasheet.ciiva.com/3232/tps2115a-3232539.pdf?src-supplier=Avnet; ComponentLink3URL: https://datasheet.ciiva.com/1961/tps2115a-1961014.pdf?src-supplier=Digi-Key; ComponentLink3Description: https://datasheet.ciiva.com/1961/tps2115a-1961014.pdf?src-supplier=Digi-Key; Supplier Part Number 1: TPS2115ADRBTG4-ND
U9 = NTGD1100LT1G: IC PWR DRIVER P-CHAN 1:1 6TSOP; Manufacturer: onsemi; Manufacturer Part No:: NTGD1100LT1G; Package: Custom; ComponentLink1Description: New link; ComponentLink1URL: https://www.digikey.co.uk/en/products/detail/onsemi/NTGD1100LT1G/1484846